# Altium project PCB_Project.PrjPcb
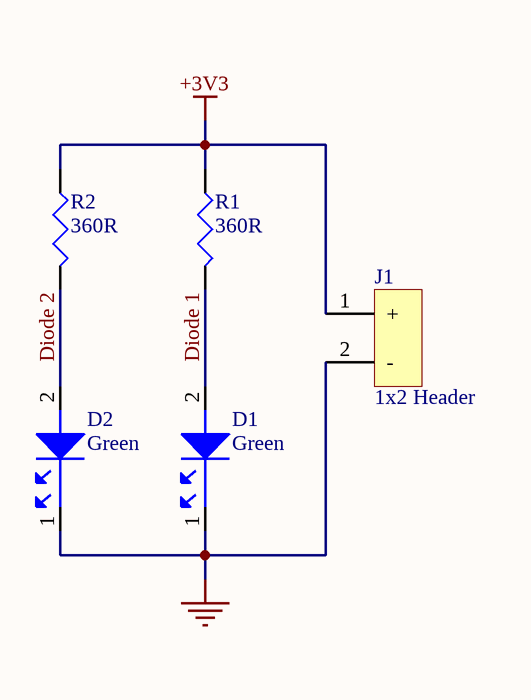
[diagram p0: LED.SchDoc]
1 sheet, 5 parts. Net scope: global (net labels, ports and power ports of the same name join across sheets).
Board file: LED.PcbDoc

## Sheet LED.SchDoc
size A; SheetNumber: 1; SheetTotal: 1

### Parts
D1  Green  [LED0603G]
D2  Green  [LED0603G]
J1  1x2 Header  [Header 1x2]
R1  360R  [R0805]
R2  360R  [R0805]

### Nets
+3V3: J1.1(+) R1.1 R2.1
GND: D1.1 D2.1 J1.2(-)
Diode 1: D1.2 R1.2
Diode 2: D2.2 R2.2

### Library data of the parts
D1 D2 = LNJ337W83RA: LNJ337W83RA, Ess II Series Yellow-green Led, 572 Nm 1608(0603), Rectangle Lens; Manufacturer: Panasonic; Dominant Wavelength: 572nm; Forward Current: 20mA; Forward Voltage: 2.3V; Lens Style: Rectangular; Luminous Intensity: 7.5mcd; Max Power Dissipation: 55mW; Number of Circuits: 1; Peak Wavelength: 575nm; Reverse Voltage: 4V; Test Current: 5mA; Supplier: Farnell; Supplier Part Number: 1908053; Manufacturer Part Number: LNJ337W83RA; RoHS: Compliant; Category: LEDs; Pricing: 5=0.178, 25=0.151, 100=0.117, 250=0.101, 500=0.0917, 1000=0.0824 (GBP); Ambient Temperature Range High: 85°C; Case/Package: 0603; Case Code (Imperial): 0603; Case Code (Metric): 1608; Color: Green; Height: 200µm; Illumination Color: Green; Lead Free: Lead Free; Length: 1.6mm; Lifecycle Status: Obsolete; Max Operating Temperature: 85°C; Min Operating Temperature: -30°C; Mounting Technology: Surface Mount; Number of LEDs: 1; Pins: 2; Number of Terminals: 2; Packaging: Bulk; Power Dissipation: 55mW; REACH SVHC: Yes; Shape: Rectangular; Wavelength: 572nm; Width: 800µm; ComponentLink1URL: https://datasheet.octopart.com:443/LNJ337W83RA-Panasonic-datasheet-156215543.pdf?src-supplier=IHS; ComponentLink1Description: https://datasheet.octopart.com:443/LNJ337W83RA-Panasonic-datasheet-156215543.pdf?src-supplier=IHS; ComponentLink2URL: https://datasheet.octopart.com:443/LNJ337W83RA-Panasonic-datasheet-108049125.pdf?src-supplier=Upverter; ComponentLink2Description: https://datasheet.octopart.com:443/LNJ337W83RA-Panasonic-datasheet-108049125.pdf?src-supplier=Upverter; ComponentLink3URL: https://datasheet.octopart.com:443/LNJ337W83RA-Panasonic-datasheet-13562500.pdf?src-supplier=element14+APAC; ComponentLink3Description: https://datasheet.octopart.com:443/LNJ337W83RA-Panasonic-datasheet-13562500.pdf?src-supplier=element14+APAC; ComponentLink4URL: https://datasheet.octopart.com:443/LNJ337W83RA-Panasonic-datasheet-10742055.pdf?src-supplier=Farnell; ComponentLink4Description: https://datasheet.octopart.com:443/LNJ337W83RA-Panasonic-datasheet-10742055.pdf?src-supplier=Farnell
J1 = 22-29-2021: KK 254 Wire-to-Board Header, Vertical, with Friction Lock, 2 Circuits, Gold (Au) Plating; Manufacturer: Molex; Manufacturer Lifecycle Status: ACTIVE; Contact Resistance: 10mΩ; Current Rating: 4A; Dielectric Material: Polyamide; Gender: Male; Glow Wire Compliant: Non-compliant; Insulation Resistance: 1GΩ; Max Voltage Rating (AC): 250V; Number of Circuits: 2; Pitch: 2.54mm; Plating: Tin; Plating Thickness: 508nm; Voltage Rating: 500V; Supplier: Arrow Electronics; Supplier Part Number: 0022292021; Manufacturer Part Number: 22-29-2021; RoHS: Compliant; Category: Connectors; Stock: 66; Pricing: 1=0.2896, 10=0.265 (USD); China RoHS: Compliant; Color: White; Contact Gender: Male; Contact Material: Brass; Contact Plating: Gold; Country of Origin: US; Depth: 5.8mm; Flammability Rating: UL94 V-0; Halogen Free: Low Halogen; Height: 12.05mm; Housing Color: White; Housing Material: Nylon; Lead Free: Lead Free; Lead Pitch: 2.54mm; Length: 12.7mm; Lifecycle Status: Production; Max Current Rating: 4A; Max Operating Temperature: 75°C; Min Operating Temperature: 0°C; Mounting Technology: Through Hole; Number of Contacts: 2; Pins: 2; Number of Positions: 2; Number of Rows: 1; Orientation: Right Angle, Vertical; Packaging: Bulk; Radiation Hardening: No; REACH SVHC: Yes; Schedule B: 8536694040, 8536694040|8536694040|8536694040|8536694040|8536694040|8536694040|8536694040|8536694040|8536694040|8536694040|8536694040|8536694040|8536694040|8536694040|8536694040|8536694040|8536694040|8536694040|8536694040|8536694040|8536694040|8536694040|8536694040|85; Terminal Pitch: 2.54mm; Termination: Through Hole; Voltage Rating (DC): 250V; ComponentLink1URL: https://sigma.octopart.com:443/81843831/technical_drawing/Molex-22-29-2021.pdf?src-supplier=Upverter; ComponentLink1Description: https://sigma.octopart.com:443/81843831/technical_drawing/Molex-22-29-2021.pdf?src-supplier=Upverter; ComponentLink2URL: https://datasheet.octopart.com:443/22-29-2021-Molex-datasheet-12556036.pdf?src-supplier=Molex; ComponentLink2Description: https://datasheet.octopart.com:443/22-29-2021-Molex-datasheet-12556036.pdf?src-supplier=Molex; ComponentLink3URL: https://datasheet.octopart.com:443/22-29-2021-Molex-datasheet-10979409.pdf?src-supplier=Molex; ComponentLink3Description: https://datasheet.octopart.com:443/22-29-2021-Molex-datasheet-10979409.pdf?src-supplier=Molex; ComponentLink4URL: https://datasheet.octopart.com:443/022292021-Molex-datasheet-5315839.pdf?src-supplier=Farnell; ComponentLink4Description: https://datasheet.octopart.com:443/022292021-Molex-datasheet-5315839.pdf?src-supplier=Farnell; ComponentLink5URL: https://datasheet.octopart.com:443/22-29-2021-Molex-datasheet-101581899.pdf?src-supplier=Farnell; ComponentLink5Description: https://datasheet.octopart.com:443/22-29-2021-Molex-datasheet-101581899.pdf?src-supplier=Farnell; ComponentLink6URL: https://datasheet.octopart.com:443/22-29-2021-Molex-datasheet-13556931.pdf?src-supplier=Farnell; ComponentLink6Description: https://datasheet.octopart.com:443/22-29-2021-Molex-datasheet-13556931.pdf?src-supplier=Farnell; ComponentLink7URL: https://datasheet.octopart.com:443/22-29-2021-Molex-datasheet-506551.pdf?src-supplier=Farnell; ComponentLink7Description: https://datasheet.octopart.com:443/22-29-2021-Molex-datasheet-506551.pdf?src-supplier=Farnell; ComponentLink8URL: https://datasheet.octopart.com:443/22-29-2021-Molex-datasheet-154747399.pdf?src-supplier=Master+Electronics; ComponentLink8Description: https://datasheet.octopart.com:443/22-29-2021-Molex-datasheet-154747399.pdf?src-supplier=Master+Electronics; ComponentLink9URL: https://datasheet.octopart.com:443/22-29-2021-Molex-datasheet-140181368.pdf?src-supplier=RS+(Formerly+Allied+Electronics); ComponentLink9Description: https://datasheet.octopart.com:443/22-29-2021-Molex-datasheet-140181368.pdf?src-supplier=RS+(Formerly+Allied+Electronics); ComponentLink10URL: https://datasheet.octopart.com:443/22-29-2021-Molex-datasheet-120146429.pdf?src-supplier=RS+(Formerly+Allied+Electronics); ComponentLink10Description: https://datasheet.octopart.com:443/22-29-2021-Molex-datasheet-120146429.pdf?src-supplier=RS+(Formerly+Allied+Electronics); ComponentLink11URL: https://datasheet.octopart.com:443/22-29-2021-Molex-datasheet-62280240.pdf?src-supplier=Electro+Sonic; ComponentLink11Description: https://datasheet.octopart.com:443/22-29-2021-Molex-datasheet-62280240.pdf?src-supplier=Electro+Sonic; ComponentLink12URL: https://datasheet.octopart.com:443/22-29-2021-Molex-datasheet-37169030.pdf?src-supplier=Electro+Sonic; ComponentLink12Description: https://datasheet.octopart.com:443/22-29-2021-Molex-datasheet-37169030.pdf?src-supplier=Electro+Sonic; ComponentLink13URL: https://datasheet.octopart.com:443/22-29-2021-Molex-datasheet-23709171.pdf?src-supplier=Electro+Sonic; ComponentLink13Description: https://datasheet.octopart.com:443/22-29-2021-Molex-datasheet-23709171.pdf?src-supplier=Electro+Sonic; ComponentLink14URL: https://datasheet.octopart.com:443/22-29-2021-Molex-datasheet-33002381.pdf?src-supplier=Newark; ComponentLink14Description: https://datasheet.octopart.com:443/22-29-2021-Molex-datasheet-33002381.pdf?src-supplier=Newark; ComponentLink15URL: https://datasheet.octopart.com:443/22-29-2021-Molex-datasheet-21827057.pdf?src-supplier=Newark; ComponentLink15Description: https://datasheet.octopart.com:443/22-29-2021-Molex-datasheet-21827057.pdf?src-supplier=Newark; ComponentLink16URL: https://datasheet.octopart.com:443/22-29-2021-Molex-datasheet-21206998.pdf?src-supplier=Newark; ComponentLink16Description: https://datasheet.octopart.com:443/22-29-2021-Molex-datasheet-21206998.pdf?src-supplier=Newark; ComponentLink17URL: https://datasheet.octopart.com:443/22-29-2021-Molex-datasheet-144804.pdf?src-supplier=DigiKey; ComponentLink17Description: https://datasheet.octopart.com:443/22-29-2021-Molex-datasheet-144804.pdf?src-supplier=DigiKey; ComponentLink18URL: https://datasheet.octopart.com:443/22-29-2021-Molex-datasheet-7277451.pdf?src-supplier=Jameco; ComponentLink18Description: https://datasheet.octopart.com:443/22-29-2021-Molex-datasheet-7277451.pdf?src-supplier=Jameco; ComponentLink19URL: https://datasheet.octopart.com:443/22-29-2021-Molex-datasheet-17586671.pdf?src-supplier=TME; ComponentLink19Description: https://datasheet.octopart.com:443/22-29-2021-Molex-datasheet-17586671.pdf?src-supplier=TME; ComponentLink20URL: http://sigma.octopart.com:80/16301842/rohs_statement/Molex-22-29-2021.pdf?src-supplier=Compliance+Statements; ComponentLink20Description: http://sigma.octopart.com:80/16301842/rohs_statement/Molex-22-29-2021.pdf?src-supplier=Compliance+Statements; ComponentLink21URL: http://sigma.octopart.com:80/reach_statement/Molex-company-74.pdf?src-supplier=Compliance+Statements; ComponentLink21Description: http://sigma.octopart.com:80/reach_statement/Molex-company-74.pdf?src-supplier=Compliance+Statements; ComponentLink22URL: http://sigma.octopart.com:80/rohs_statement/Molex-company-73.pdf?src-supplier=Compliance+Statements; ComponentLink22Description: http://sigma.octopart.com:80/rohs_statement/Molex-company-73.pdf?src-supplier=Compliance+Statements; ComponentLink23URL: http://sigma.octopart.com:80/conflict_mineral_statement/Molex-company-72.pdf?src-supplier=Compliance+Statements; ComponentLink23Description: http://sigma.octopart.com:80/conflict_mineral_statement/Molex-company-72.pdf?src-supplier=Compliance+Statements
R1 R2 = CRCW0805360RFKEA: CRCW FIXED RESISTOR 0805 (2012Metric) Chip Resistor ±1% ±100ppm/C 360Ohm 0.125W 1/8W; Manufacturer: Vishay; Manufacturer Package Identifier: CRCW0805-e3; Max Power Dissipation: 125mW; Value: 360Ω; Temperature Coefficient: 100ppm/°C; Voltage Rating: 150V; Supplier: Avnet; Supplier Part Number: 42K4495; Manufacturer Part Number: CRCW0805360RFKEA; RoHS: Compliant; Category: Resistors; Stock: 10000; Pricing: 5000=0.008, 10000=0.007 (USD); Case/Package: 0805; Case Code (Imperial): 0805; China RoHS: Non-Compliant; Composition: Thick Film; Contact Plating: Tin; Depth: 1.25mm; Features: Automotive AEC-Q200; Height: 450µm; Lead Free: Lead Free; Length: 2mm; Lifecycle Status: Production; Max Operating Temperature: 155°C; Military Standard: Not; Min Operating Temperature: -55°C; Mounting Technology: Surface Mount; Pins: 2; Number of Terminals: 2; Number of Terminations: 2; Packaging: Cut Tape; Power Dissipation: 125mW; Power Rating: 125mW; Radiation Hardening: No; REACH SVHC: Yes; Schedule B: 8533210045, 8533210045|8533210045, 8533210045|8533210045|8533210045, 8533210045|8533210045|8533210045|8533210045; Termination: SMD/SMT; Tolerance: 1%; Voltage Rating (DC): 150V; Weight: 5.499807mg; Width: 1.25mm; Working Voltage: 150V; ComponentLink1URL: https://datasheet.octopart.com:443/CRCW0805360RFKEA-Vishay-datasheet-175423584.pdf?src-supplier=IHS; ComponentLink1Description: https://datasheet.octopart.com:443/CRCW0805360RFKEA-Vishay-datasheet-175423584.pdf?src-supplier=IHS; ComponentLink2URL: https://datasheet.octopart.com:443/CRCW0805360RFKEA-Vishay-datasheet-66077789.pdf?src-supplier=element14+APAC; ComponentLink2Description: https://datasheet.octopart.com:443/CRCW0805360RFKEA-Vishay-datasheet-66077789.pdf?src-supplier=element14+APAC; ComponentLink3URL: https://datasheet.octopart.com:443/CRCW0805360RFKEA-Vishay-datasheet-62317937.pdf?src-supplier=element14+APAC; ComponentLink3Description: https://datasheet.octopart.com:443/CRCW0805360RFKEA-Vishay-datasheet-62317937.pdf?src-supplier=element14+APAC; ComponentLink4URL: https://datasheet.octopart.com:443/CRCW0805360RFKEA-Vishay-datasheet-33013972.pdf?src-supplier=element14+APAC; ComponentLink4Description: https://datasheet.octopart.com:443/CRCW0805360RFKEA-Vishay-datasheet-33013972.pdf?src-supplier=element14+APAC; ComponentLink5URL: https://datasheet.octopart.com:443/CRCW0805360RFKEA.-Vishay-datasheet-83961561.pdf?src-supplier=element14+APAC; ComponentLink5Description: https://datasheet.octopart.com:443/CRCW0805360RFKEA.-Vishay-datasheet-83961561.pdf?src-supplier=element14+APAC; ComponentLink6URL: https://datasheet.octopart.com:443/CRCW0805360RFKEA-Vishay-datasheet-14722531.pdf?src-supplier=element14+APAC; ComponentLink6Description: https://datasheet.octopart.com:443/CRCW0805360RFKEA-Vishay-datasheet-14722531.pdf?src-supplier=element14+APAC; ComponentLink7URL: https://datasheet.octopart.com:443/CRCW0805360RFKEA-Vishay-datasheet-31669108.pdf?src-supplier=Farnell; ComponentLink7Description: https://datasheet.octopart.com:443/CRCW0805360RFKEA-Vishay-datasheet-31669108.pdf?src-supplier=Farnell; ComponentLink8URL: https://datasheet.octopart.com:443/CRCW0805360RFKEA-Vishay-datasheet-11761042.pdf?src-supplier=Newark; ComponentLink8Description: https://datasheet.octopart.com:443/CRCW0805360RFKEA-Vishay-datasheet-11761042.pdf?src-supplier=Newark; ComponentLink9URL: https://datasheet.octopart.com:443/CRCW0805360RFKEA-Vishay-datasheet-11516975.pdf?src-supplier=Newark; ComponentLink9Description: https://datasheet.octopart.com:443/CRCW0805360RFKEA-Vishay-datasheet-11516975.pdf?src-supplier=Newark; ComponentLink10URL: https://datasheet.octopart.com:443/CRCW0805360RFKEA-Vishay-datasheet-159614168.pdf?src-supplier=Newark; ComponentLink10Description: https://datasheet.octopart.com:443/CRCW0805360RFKEA-Vishay-datasheet-159614168.pdf?src-supplier=Newark; ComponentLink11URL: https://datasheet.octopart.com:443/CRCW0805360RFKEA-Vishay-datasheet-41302739.pdf?src-supplier=Newark; ComponentLink11Description: https://datasheet.octopart.com:443/CRCW0805360RFKEA-Vishay-datasheet-41302739.pdf?src-supplier=Newark; ComponentLink12URL: https://datasheet.octopart.com:443/CRCW0805360RFKEA-Vishay-datasheet-62316122.pdf?src-supplier=Future+Electronics; ComponentLink12Description: https://datasheet.octopart.com:443/CRCW0805360RFKEA-Vishay-datasheet-62316122.pdf?src-supplier=Future+Electronics; ComponentLink13URL: https://datasheet.octopart.com:443/CRCW0805360RFKEA-Vishay-datasheet-12519820.pdf?src-supplier=Future+Electronics; ComponentLink13Description: https://datasheet.octopart.com:443/CRCW0805360RFKEA-Vishay-datasheet-12519820.pdf?src-supplier=Future+Electronics; ComponentLink14URL: https://datasheet.octopart.com:443/CRCW0805360RFKEA-Vishay-Dale-datasheet-47688880.pdf?src-supplier=RS+(Formerly+Allied+Electronics); ComponentLink14Description: https://datasheet.octopart.com:443/CRCW0805360RFKEA-Vishay-Dale-datasheet-47688880.pdf?src-supplier=RS+(Formerly+Allied+Electronics); ComponentLink15URL: https://datasheet.octopart.com:443/CRCW0805360RFKEA-Vishay-datasheet-12001583.pdf?src-supplier=RS+(Formerly+Allied+Electronics); ComponentLink15Description: https://datasheet.octopart.com:443/CRCW0805360RFKEA-Vishay-datasheet-12001583.pdf?src-supplier=RS+(Formerly+Allied+Electronics); ComponentLink16URL: https://datasheet.octopart.com:443/CRCW0805360RFKEA-Vishay-datasheet-5306405.pdf?src-supplier=RS+(Formerly+Allied+Electronics); ComponentLink16Description: https://datasheet.octopart.com:443/CRCW0805360RFKEA-Vishay-datasheet-5306405.pdf?src-supplier=RS+(Formerly+Allied+Electronics); ComponentLink17URL: https://datasheet.octopart.com:443/CRCW0805360RFKEA-Vishay-datasheet-8445837.pdf?src-supplier=element14; ComponentLink17Description: https://datasheet.octopart.com:443/CRCW0805360RFKEA-Vishay-datasheet-8445837.pdf?src-supplier=element14; ComponentLink18URL: http://sigma.octopart.com:80/rohs_statement/Vishay-company-15.pdf?src-supplier=Compliance+Statements; ComponentLink18Description: http://sigma.octopart.com:80/rohs_statement/Vishay-company-15.pdf?src-supplier=Compliance+Statements

## Assembly variants
LED 2 Not Fitted: not fitted D2 R2